# Altium project Bio-Tracking-Device.PrjPcb (part 3 of 4)

## Sheet Controller-Sheet.SchDoc
size 420 x 297 mm; SheetNumber: 4; SheetTotal: 6
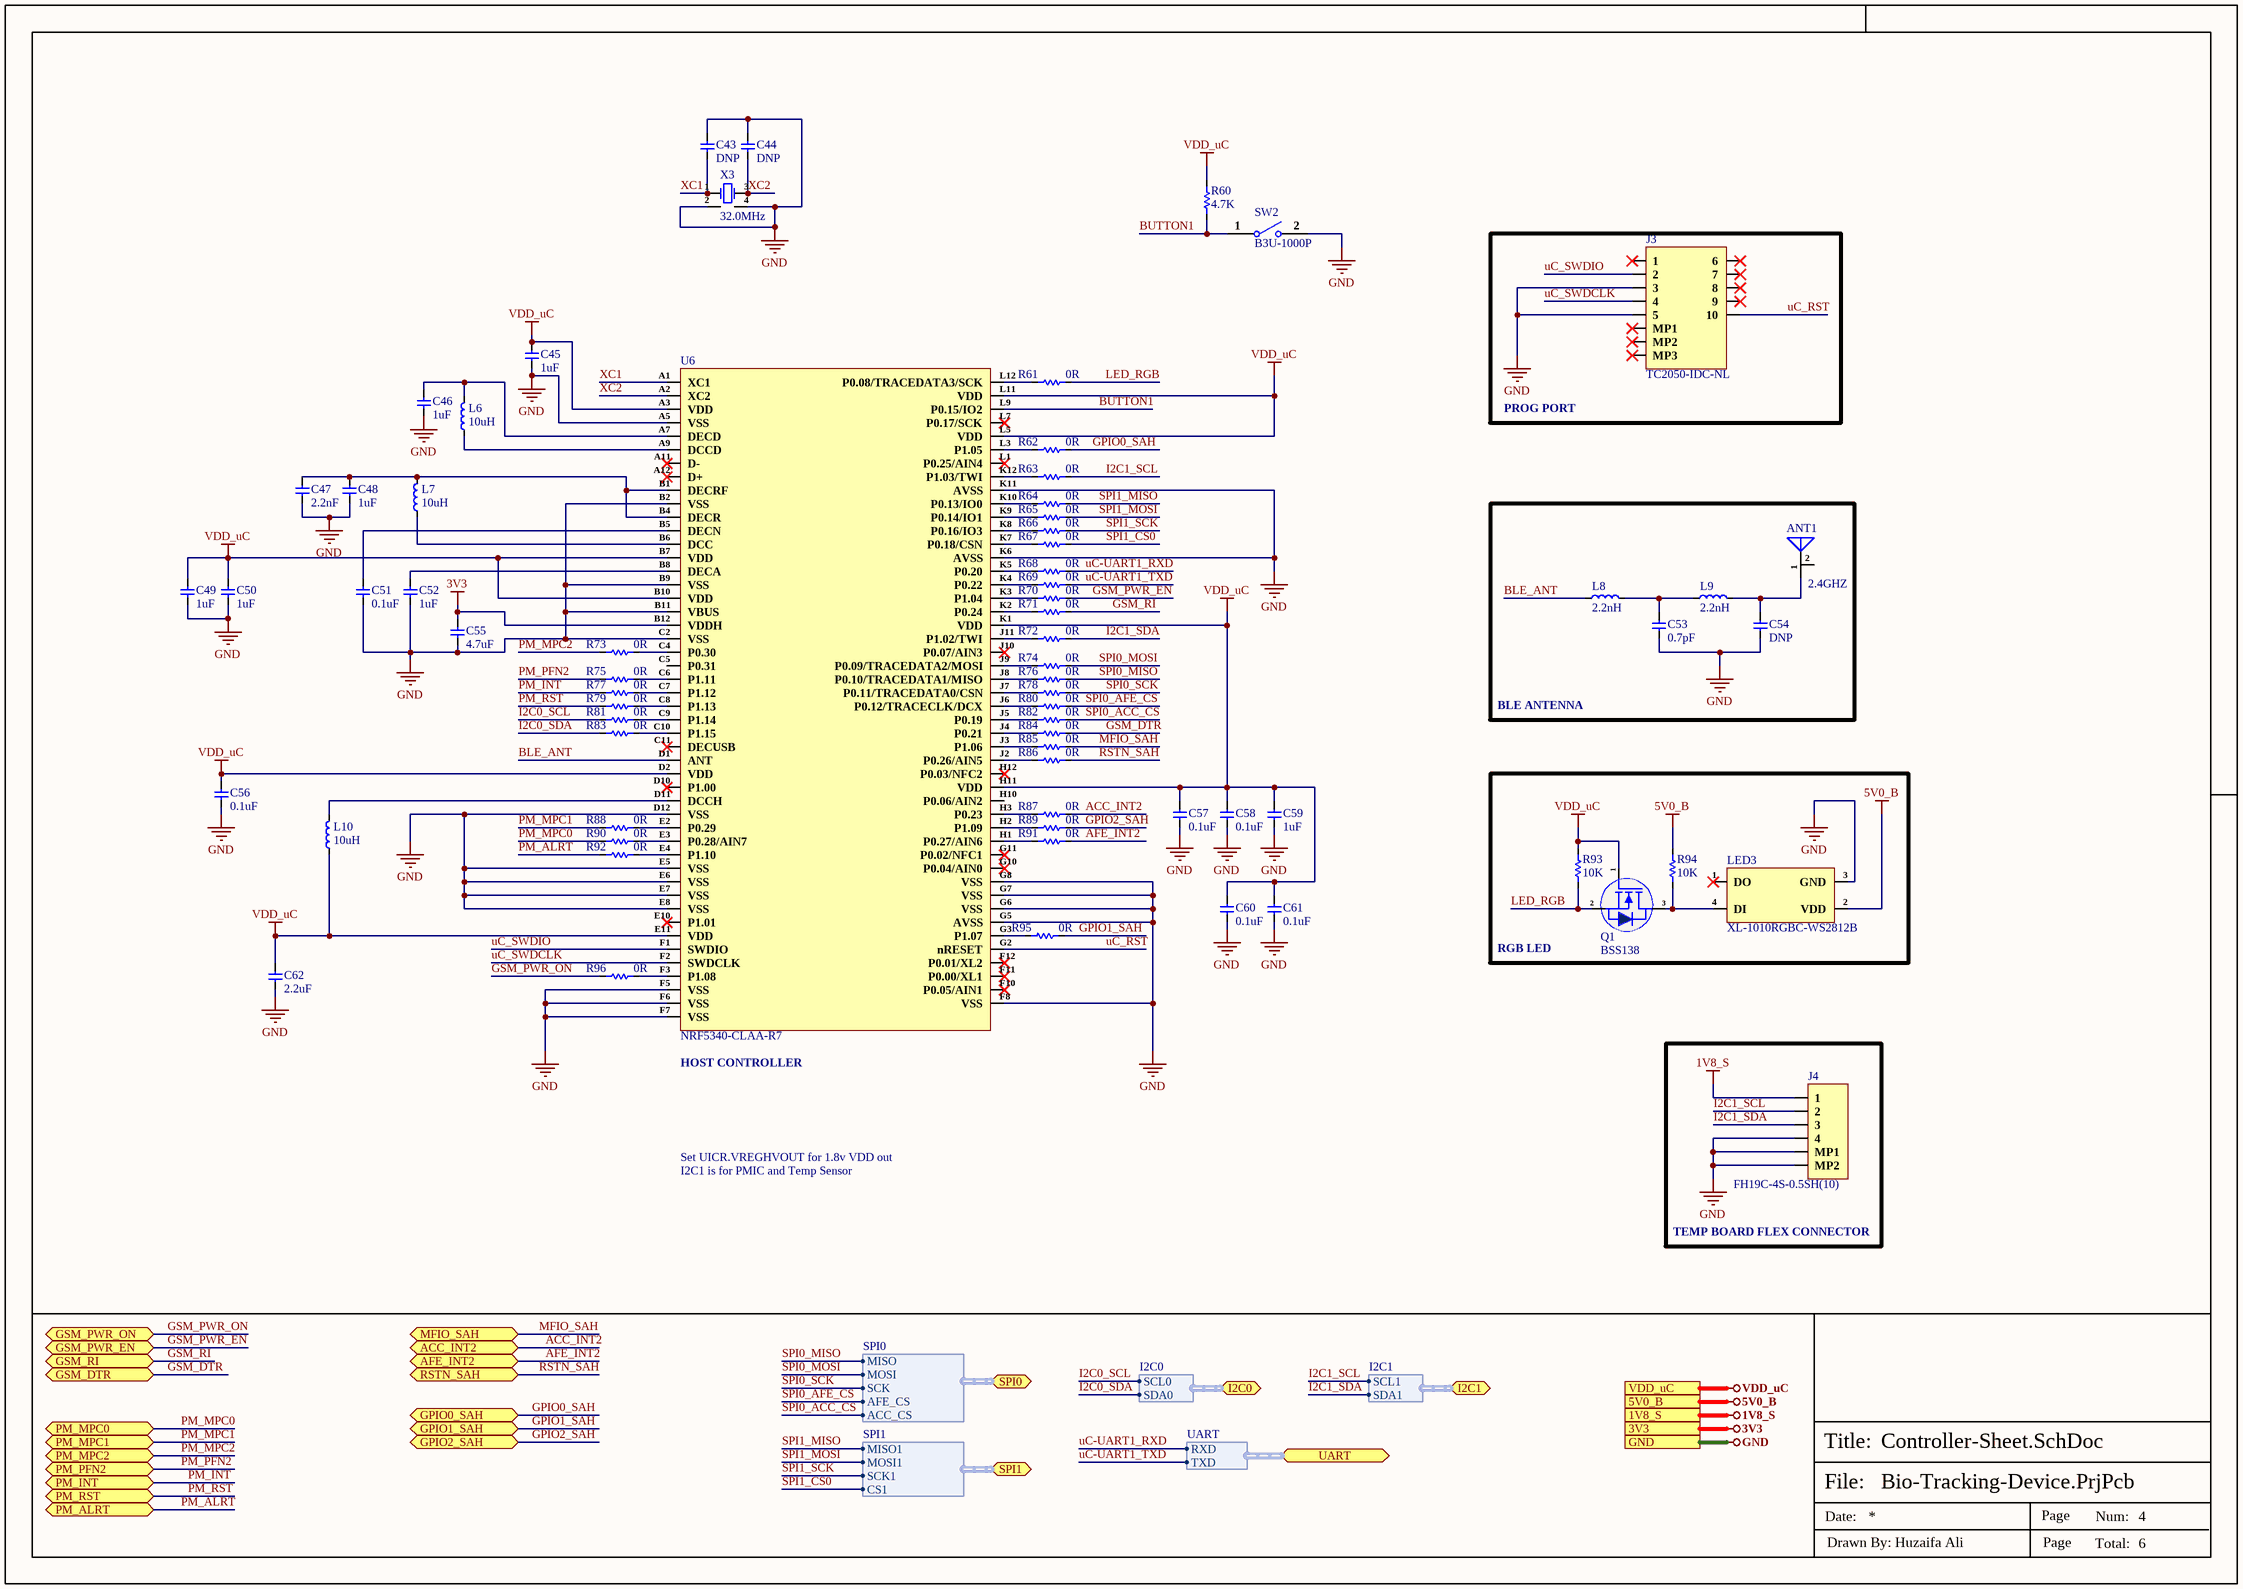
[diagram p3: Controller-Sheet.SchDoc]

### Parts
ANT1  2.4GHZ  [RFANT3216120A5T]
C43  DNP  [CAP-0201]
C44  DNP  [CAP-0201]
C45  1uF  [Cap-0402]
C46  1uF  [Cap-0402]
C47  2.2nF  [CAP-0201]
C48  1uF  [Cap-0402]
C49  1uF  [Cap-0402]
C50  1uF  [Cap-0402]
C51  0.1uF  [CAP-0201]
C52  1uF  [Cap-0402]
C53  0.7pF  [CAP-0201]
C54  DNP  [CAP-0201]
C55  4.7uF  [Cap-0603]
C56  0.1uF  [CAP-0201]
C57  0.1uF  [CAP-0201]
C58  0.1uF  [CAP-0201]
C59  1uF  [Cap-0402]
C60  0.1uF  [CAP-0201]
C61  0.1uF  [CAP-0201]
C62  2.2uF  [Cap-0603]
J3  TC2050-IDC-NL  [TC2050-IDC-NL_]
J4  FH19C-4S-0.5SH(10)  [FH19C-4S-0.5SH(10)]
L6  10uH  [IND-0603 (1608 Metric)]
L7  10uH  [IND-0603 (1608 Metric)]
L8  2.2nH  [IND-0201]
L9  2.2nH  [IND-0201]
L10  10uH  [IND-0603 (1608 Metric)]
LED3  XL-1010RGBC-WS2812B  [XL-1010RGBC-WS2812B]
Q1  BSS138  [Sot-23]
R60  4.7K  [Res-0201]
R61  0R  [Res-0201]
R62  0R  [Res-0201]
R63  0R  [Res-0201]
R64  0R  [Res-0201]
R65  0R  [Res-0201]
R66  0R  [Res-0201]
R67  0R  [Res-0201]
R68  0R  [Res-0201]
R69  0R  [Res-0201]
R70  0R  [Res-0201]
R71  0R  [Res-0201]
R72  0R  [Res-0201]
R73  0R  [Res-0201]
R74  0R  [Res-0201]
R75  0R  [Res-0201]
R76  0R  [Res-0201]
R77  0R  [Res-0201]
R78  0R  [Res-0201]
R79  0R  [Res-0201]
R80  0R  [Res-0201]
R81  0R  [Res-0201]
R82  0R  [Res-0201]
R83  0R  [Res-0201]
R84  0R  [Res-0201]
R85  0R  [Res-0201]
R86  0R  [Res-0201]
R87  0R  [Res-0201]
R88  0R  [Res-0201]
R89  0R  [Res-0201]
R90  0R  [Res-0201]
R91  0R  [Res-0201]
R92  0R  [Res-0201]
R93  10K  [Res-0402]
R94  10K  [Res-0402]
R95  0R  [Res-0201]
R96  0R  [Res-0201]
SW2  B3U-1000P  [B3U-1000P]
U6  NRF5340-CLAA-R7  [95-WLCSP (4.39x3.85)]
X3  32.0MHz  [SMD2016-4P]

### Blocks framed on the sheet
PROG PORT: J3
BLE ANTENNA: ANT1 C53 C54 L8 L9
RGB LED: LED3 Q1 R93 R94
TEMP BOARD FLEX CONNECTOR: J4

### Ports
1V8_S (see Top-Sheet[3B], Power-Sheet[5D], Sensor-Sheet[5D], Temp-Sensor-Sheet[3D]), 3V3 (see Top-Sheet[3A], Power-Sheet[5D], Sensor-Sheet[5D]), 5V0_B (see Top-Sheet[3B], Power-Sheet[5D], Sensor-Sheet[5D]), ACC_INT2 (bidir, see Top-Sheet[4B], Sensor-Sheet[1D]), AFE_INT2 (bidir, see Top-Sheet[4B], Sensor-Sheet[1D]), GND (see Top-Sheet[3A], GSM-Sheet[5D], Power-Sheet[5D], Sensor-Sheet[5D], Temp-Sensor-Sheet[3D]), GPIO0_SAH (bidir, see Top-Sheet[4B], Sensor-Sheet[1D]), GPIO1_SAH (bidir, see Top-Sheet[4B], Sensor-Sheet[1D]), GPIO2_SAH (bidir, see Top-Sheet[4B], Sensor-Sheet[1D]), GSM_DTR (bidir, see Top-Sheet[3B], GSM-Sheet[1D]), GSM_PWR_EN (bidir, see Top-Sheet[3B], Power-Sheet[1D]), GSM_PWR_ON (bidir, see Top-Sheet[3B], GSM-Sheet[1D]), GSM_RI (bidir, see Top-Sheet[3B], GSM-Sheet[1D]), I2C0 (bidir, harness I2C0, see Top-Sheet[4B], Sensor-Sheet[3D]), I2C1 (bidir, harness I2C1, see Top-Sheet[4C], Power-Sheet[3D], Temp-Sensor-Sheet[2D]), MFIO_SAH (bidir, see Top-Sheet[4B], Sensor-Sheet[1D]), PM_ALRT (bidir, see Top-Sheet[3B], Power-Sheet[1D]), PM_INT (bidir, see Top-Sheet[3B], Power-Sheet[1D]), PM_MPC0 (bidir, see Top-Sheet[3B], Power-Sheet[1D]), PM_MPC1 (bidir, see Top-Sheet[3B], Power-Sheet[1D]), PM_MPC2 (bidir, see Top-Sheet[3B], Power-Sheet[1D]), PM_PFN2 (bidir, see Top-Sheet[3B], Power-Sheet[1D]), PM_RST (bidir, see Top-Sheet[3B], Power-Sheet[1D]), RSTN_SAH (bidir, see Top-Sheet[4B], Sensor-Sheet[1D]), SPI0 (bidir, harness SPI0, see Top-Sheet[4B], Sensor-Sheet[4D]), SPI1 (bidir, harness SPI1, see Top-Sheet[4B], Sensor-Sheet[4D]), UART (bidir, harness UART, see Top-Sheet[3B], GSM-Sheet[3D]), VDD_uC (see Top-Sheet[3B], GSM-Sheet[5D], Power-Sheet[5D])

### Harnesses
I2C0: SCL0, SDA0
I2C1: SCL1, SDA1
UART: RXD, TXD
SPI1: MISO1, MOSI1, SCK1, CS1
SPI0: MISO, MOSI, SCK, AFE_CS, ACC_CS

### Nets
1V8_S: J4.1 ; port 1V8_S
3V3: C55.2 U6.B12(VDDH) ; port 3V3
5V0_B: LED3.2(VDD) R94.2 ; port 5V0_B
GND: C43.2 C44.2 C45.1 C46.1 C47.1 C48.1 C49.1 C50.1 C51.1 C52.1 C53.1 C54.1 C55.1 C56.1 C57.1 C58.1 C59.1 C60.1 C61.1 C62.1 J3.3 J3.5 J4.4 J4.MP1 J4.MP2 LED3.3(GND) SW2.2 U6.A5(VSS) U6.B2(VSS) U6.B9(VSS) U6.B11(VBUS) U6.C2(VSS) U6.D12(VSS) U6.E5(VSS) U6.E6(VSS) U6.E7(VSS) U6.E8(VSS) U6.F5(VSS) U6.F6(VSS) U6.F7(VSS) U6.F8(VSS) U6.G5(AVSS) U6.G6(VSS) U6.G7(VSS) U6.G8(VSS) U6.K6(AVSS) U6.K11(AVSS) X3.2(GND) X3.4(GND) ; port GND
VDD_uC: C45.2 C49.2 C50.2 C56.2 C57.2 C58.2 C59.2 C60.2 C61.2 C62.2 L10.1 Q1.1(G) R60.2 R93.2 U6.A3(VDD) U6.B7(VDD) U6.B10(VDD) U6.D2(VDD) U6.E11(VDD) U6.H11(VDD) U6.K1(VDD) U6.L5(VDD) U6.L11(VDD) ; port VDD_uC
ACC_INT2: R87.2 ; port ACC_INT2
AFE_INT2: R91.2 ; port AFE_INT2
BLE_ANT: L8.1 U6.D1(ANT)
BUTTON1: R60.1 SW2.1 U6.L9(P0.15/IO2)
GPIO0_SAH: R62.2 ; port GPIO0_SAH
GPIO1_SAH: R95.2 ; port GPIO1_SAH
GPIO2_SAH: R89.2 ; port GPIO2_SAH
GSM_DTR: R84.2 ; port GSM_DTR
GSM_PWR_EN: R70.2 ; port GSM_PWR_EN
GSM_PWR_ON: R96.1 ; port GSM_PWR_ON
GSM_RI: R71.2 ; port GSM_RI
I2C0_SCL: R81.1 ; port I2C0.SCL0
I2C0_SDA: R83.1 ; port I2C0.SDA0
I2C1_SCL: J4.2 R63.2 ; port I2C1.SCL1
I2C1_SDA: J4.3 R72.2 ; port I2C1.SDA1
LED_RGB: Q1.2(S) R61.2 R93.1
MFIO_SAH: R85.2 ; port MFIO_SAH
PM_ALRT: R92.1 ; port PM_ALRT
PM_INT: R77.1 ; port PM_INT
PM_MPC0: R90.1 ; port PM_MPC0
PM_MPC1: R88.1 ; port PM_MPC1
PM_MPC2: R73.1 ; port PM_MPC2
PM_PFN2: R75.1 ; port PM_PFN2
PM_RST: R79.1 ; port PM_RST
RSTN_SAH: R86.2 ; port RSTN_SAH
SPI0_ACC_CS: R82.2 ; port SPI0.ACC_CS
SPI0_AFE_CS: R80.2 ; port SPI0.AFE_CS
SPI0_MISO: R76.2 ; port SPI0.MISO
SPI0_MOSI: R74.2 ; port SPI0.MOSI
SPI0_SCK: R78.2 ; port SPI0.SCK
SPI1_CS0: R67.2 ; port SPI1.CS1
SPI1_MISO: R64.2 ; port SPI1.MISO1
SPI1_MOSI: R65.2 ; port SPI1.MOSI1
SPI1_SCK: R66.2 ; port SPI1.SCK1
uC-UART1_RXD: R68.2 ; port UART.RXD
uC-UART1_TXD: R69.2 ; port UART.TXD
uC_RST: J3.10 U6.G2(nRESET)
uC_SWDCLK: J3.4 U6.F2(SWDCLK)
uC_SWDIO: J3.2 U6.F1(SWDIO)
XC1: C43.1 U6.A1(XC1) X3.1(IN/OUT)
XC2: C44.1 U6.A2(XC2) X3.3(Out/In)
NetANT1_1: ANT1.1(A) C54.2 L9.2
NetC46_2: C46.2 L6.2 U6.A7(DECD)
NetC47_2: C47.2 C48.2 L7.2 U6.B1(DECRF) U6.B4(DECR)
NetC51_2: C51.2 U6.B5(DECN)
NetC52_2: C52.2 U6.B8(DECA)
NetC53_2: C53.2 L8.2 L9.1
NetL6_1: L6.1 U6.A9(DCCD)
NetL7_1: L7.1 U6.B6(DCC)
NetL10_2: L10.2 U6.D11(DCCH)
NetLED3_4: LED3.4(DI) Q1.3(D) R94.1
NetR61_1: R61.1 U6.L12(P0.08/TRACEDATA3/SCK)
NetR62_1: R62.1 U6.L3(P1.05)
NetR63_1: R63.1 U6.K12(P1.03/TWI)
NetR64_1: R64.1 U6.K10(P0.13/IO0)
NetR65_1: R65.1 U6.K9(P0.14/IO1)
NetR66_1: R66.1 U6.K8(P0.16/IO3)
NetR67_1: R67.1 U6.K7(P0.18/CSN)
NetR68_1: R68.1 U6.K5(P0.20)
NetR69_1: R69.1 U6.K4(P0.22)
NetR70_1: R70.1 U6.K3(P1.04)
NetR71_1: R71.1 U6.K2(P0.24)
NetR72_1: R72.1 U6.J11(P1.02/TWI)
NetR73_2: R73.2 U6.C4(P0.30)
NetR74_1: R74.1 U6.J9(P0.09/TRACEDATA2/MOSI)
NetR75_2: R75.2 U6.C6(P1.11)
NetR76_1: R76.1 U6.J8(P0.10/TRACEDATA1/MISO)
NetR77_2: R77.2 U6.C7(P1.12)
NetR78_1: R78.1 U6.J7(P0.11/TRACEDATA0/CSN)
NetR79_2: R79.2 U6.C8(P1.13)
NetR80_1: R80.1 U6.J6(P0.12/TRACECLK/DCX)
NetR81_2: R81.2 U6.C9(P1.14)
NetR82_1: R82.1 U6.J5(P0.19)
NetR83_2: R83.2 U6.C10(P1.15)
NetR84_1: R84.1 U6.J4(P0.21)
NetR85_1: R85.1 U6.J3(P1.06)
NetR86_1: R86.1 U6.J2(P0.26/AIN5)
NetR87_1: R87.1 U6.H3(P0.23)
NetR88_2: R88.2 U6.E2(P0.29)
NetR89_1: R89.1 U6.H2(P1.09)
NetR90_2: R90.2 U6.E3(P0.28/AIN7)
NetR91_1: R91.1 U6.H1(P0.27/AIN6)
NetR92_2: R92.2 U6.E4(P1.10)
NetR95_1: R95.1 U6.G3(P1.07)
NetR96_2: R96.2 U6.F3(P1.08)

Not connected (* = marked no-connect by the designer): ANT1 2(NC); J3 1* 6* 7* 8* 9* MP1* MP2* MP3*; LED3 1(DO)*; U6 A11(D-)* A12(D+)* C5(P0.31) C11(DECUSB)* D10(P1.00)* E10(P1.01)* F10(P0.05/AIN1)* F11(P0.00/XL1)* F12(P0.01/XL2)* G10(P0.04/AIN0)* G11(P0.02/NFC1)* H10(P0.06/AIN2) H12(P0.03/NFC2)* J10(P0.07/AIN3)* L1(P0.25/AIN4)* L7(P0.17/SCK)*

### Notes on the sheet
- (near U6) HOST CONTROLLER
- Set UICR.VREGHVOUT for 1.8v VDD out
- I2C1 is for PMIC and Temp Sensor
- File:
- Title:
- Date:
- Page
- Num:
- Total:
- Drawn By: Huzaifa Ali

### Library data of the parts
ANT1 = RFANT3216120A5T: 2.4GHZ CERAMIC CHIP ANTENNA; Manufacturer: Walsin Technologies; Bandwidth: 150MHz; Impedance: 50R; Number of Bands: 1; VSWR: 2; Supplier: Digikey; Supplier Part Number: 1292-1000-1-ND; Manufacturer Part Number: RFANT3216120A5T; RoHS: Yes; Category: RF Antennas; Stock: 28669; Pricing: 1=0.5, 10=0.403, 25=0.3692, 100=0.2747, 250=0.24896, 500=0.20604, 1000=0.15453 (USD); Mounting Technology: Surface Mount; Case/Package: CSMD; Pins: 2; Package Quantity: 2000; Packaging: Tape and Reel; Frequency: 2.4GHz; Termination: Solder; Series: -; Radiation Hardening: No; ComponentLink1URL: https://datasheet.ciiva.com/26865/getdatasheetpartid-490374-26865067.pdf?src-supplier=Verical; ComponentLink1Description: https://datasheet.ciiva.com/26865/getdatasheetpartid-490374-26865067.pdf?src-supplier=Verical; ComponentLink2URL: https://datasheet.ciiva.com/26233/1-2rfant3216120a5t-26233244.pdf?src-supplier=Digikey; ComponentLink2Description: https://datasheet.ciiva.com/26233/1-2rfant3216120a5t-26233244.pdf?src-supplier=Digikey; ComponentLink3URL: https://datasheet.ciiva.com/26233/1-2rfant3216120a5t-26233238.pdf?src-supplier=Digikey; ComponentLink3Description: https://datasheet.ciiva.com/26233/1-2rfant3216120a5t-26233238.pdf?src-supplier=Digikey; LCSC Part Number: C127629; Item Type: Antenna
C43 C44 = GRM0335C1E2R0BA01D: CAP CER 2PF 25V C0G/NP0 0201; Manufacturer: Murata; Item Type: Capacitor; Supplier 1: Arrow Electronics; Manufacturer Part Number: GRM0335C1E2R0BA01D; RoHS: Yes; Category: Ceramic Capacitors; Stock 1: 65754; Pricing 1: 1=0.053, 10=0.0058, 25=0.004, 100=0.0026, 500=0.0024, 1000=0.0023, 3000=0.0022, 6000=0.0021, 15000=0.002, 30000=0.0019 (USD); ComponentLink1URL: https://datasheet.ciiva.com/29535/grm0335c1e2r0ba01-01-29535294.pdf?src-supplier=Digi-Key; ComponentLink1Description: https://datasheet.ciiva.com/29535/grm0335c1e2r0ba01-01-29535294.pdf?src-supplier=Digi-Key; Supplier Part Number 1: GRM0335C1E2R0BA01D; LCSC Part Number: C161383
C45 C46 C48-C50 C52 C59 = GRM155C71C105KE11D: CAP CER 1UF 16V X7S 0402; Manufacturer: Murata; Item Type: Capacitors; Material: 4241ConductorMaterial; Tolerance: 10%; Dielectric: 1542DielectricType; Supplier: Mouser; LCSC Part Number: C576449; Manufacturer Part Number: GRM155C71C105KE11D; RoHS: No; Stock: 16102; Pricing: 1=0.11, 10=0.041, 50=0.041, 100=0.026, 1000=0.023, 10000=0.016 (USD); Case/Package: 343Case; Min Operating Temperature: -55°C; Max Operating Temperature: 125°C; Value: 1uF; Voltage Rating: 16V; Voltage Rating (DC): 16V; Length: 1mm; Width: 500um; Height: 600um; Thickness: 500um
C47 = CC0201JRX7R7BB222: CAP CER 2200PF 16V X7R 0201; Manufacturer: Yageo; Item Type: Capacitors; Tolerance: 5%; Supplier: Digikey; LCSC Part Number: C526940; Manufacturer Part Number: CC0201JRX7R7BB222; RoHS: Yes; Stock: 18403; Pricing: 1=0.1, 10=0.035, 50=0.02, 100=0.0155, 500=0.0117, 1000=0.00919, 2500=0.00836, 5000=0.00769 (USD); Mounting Technology: Surface Mount; Case/Package: 0201; Min Operating Temperature: -55°C; Max Operating Temperature: 125°C; Packaging: Tape and Reel; Value: 2.2nF; Voltage Rating: 16V; Voltage Rating (DC): 16V; Dielectric: X7R; Series: CC; Lead Free: Lead Free; Halogen Free: Halogen Free; ComponentLink1URL: http://www.yageo.com/documents/recent/UPY-GPHC_X7R_6.3V-to-50V_18.pdf?src-supplier=Digikey; ComponentLink1Description: http://www.yageo.com/documents/recent/UPY-GPHC_X7R_6.3V-to-50V_18.pdf?src-supplier=Digikey
C51 C56-C58 C60 C61 = GRM033C71C104KE14D: CAP CER 0.1UF 16V X7S 0201; Manufacturer: Murata; Item Type: Capacitors; Material: 4241ConductorMaterial; Supplier: Future Electronics; LCSC Part Number: C85923; Manufacturer Part Number: GRM033C71C104KE14D; RoHS: Yes; Stock: 15000; Pricing: 15000=0.0042, 45000=0.0041, 75000=0.004, 300000=0.0038, 450000=0.0037 (USD); ComponentLink1URL: http://www.mouser.com/ds/2/281/c02e-2905.pdf?src-supplier=Mouser; ComponentLink1Description: http://www.mouser.com/ds/2/281/c02e-2905.pdf?src-supplier=Mouser; ComponentLink2URL: http://www.farnell.com/datasheets/2867828.pdf?src-supplier=Farnell; ComponentLink2Description: http://www.farnell.com/datasheets/2867828.pdf?src-supplier=Farnell; ComponentLink3URL: http://www.farnell.com/datasheets/2867828.pdf?src-supplier=Newark; ComponentLink3Description: http://www.farnell.com/datasheets/2867828.pdf?src-supplier=Newark; ComponentLink4URL: http://www.farnell.com/datasheets/2867828.pdf?src-supplier=Element14; ComponentLink4Description: http://www.farnell.com/datasheets/2867828.pdf?src-supplier=Element14; ComponentLink5URL: https://search.murata.co.jp/Ceramy/image/img/A01X/G101/ENG/GRM033C71C104KE14-01.pdf?src-supplier=Digikey; ComponentLink5Description: https://search.murata.co.jp/Ceramy/image/img/A01X/G101/ENG/GRM033C71C104KE14-01.pdf?src-supplier=Digikey; ComponentLink6URL: https://datasheet.octopart.com/GRM033C71C104KE14D-Murata-datasheet-22122223.pdf?src-supplier=Future+Electronics; ComponentLink6Description: https://datasheet.octopart.com/GRM033C71C104KE14D-Murata-datasheet-22122223.pdf?src-supplier=Future+Electronics; ComponentLink7URL: https://datasheet.octopart.com/GRM033C71C104KE14D-Murata-datasheet-165579666.pdf?src-supplier=TME; ComponentLink7Description: https://datasheet.octopart.com/GRM033C71C104KE14D-Murata-datasheet-165579666.pdf?src-supplier=TME
C53 C54 = GJM0335C1ER70WB01D: CAP CER 0.70PF 25V NP0 0201; Manufacturer: Murata; Item Type: Capacitors; Supplier: Mouser; LCSC Part Number: C907945; Manufacturer Part Number: GJM0335C1ER70WB01D; RoHS: Yes; Stock: 12907; Pricing: 1=0.13, 10=0.051, 50=0.051, 100=0.031, 1000=0.025, 10000=0.02 (USD); ComponentLink1URL: https://datasheet.ciiva.com/170/product-170844.pdf?src-supplier=Digikey; ComponentLink1Description: https://datasheet.ciiva.com/170/product-170844.pdf?src-supplier=Digikey; ComponentLink2URL: https://datasheet.ciiva.com/11616/product-11616940.pdf?src-supplier=Avnet; ComponentLink2Description: https://datasheet.ciiva.com/11616/product-11616940.pdf?src-supplier=Avnet
C55 = GRM188C71C475KE21D: CAP CER 4.7UF 16V X7S 0603; Manufacturer: Murata; Item Type: Capacitors; Material: 4241ConductorMaterial; Tolerance: 10%; Dielectric: 1542DielectricType; Supplier: Mouser; LCSC Part Number: C237615; Manufacturer Part Number: GRM188C71C475KE21D; RoHS: Yes; Stock: 23513; Pricing: 1=0.27, 10=0.113, 50=0.113, 100=0.075, 1000=0.067, 10000=0.046 (USD); Mounting Technology: Surface Mount; Case/Package: 0603; Min Operating Temperature: -55°C; Max Operating Temperature: 125°C; Series: GRM; Voltage Rating: 16V; Voltage Rating (DC): 16V; Value: 4.7uF; Length: 1.6mm; Width: 800um; Height: 950um; Thickness: 800um; RoHS Compliant: Yes; ComponentLink1URL: http://search.murata.co.jp/Ceramy/image/img/A01X/G101/ENG/GRM188C71C475KE21-01.pdf?src-supplier=Digikey; ComponentLink1Description: http://search.murata.co.jp/Ceramy/image/img/A01X/G101/ENG/GRM188C71C475KE21-01.pdf?src-supplier=Digikey
C62 = CL10Y225KO96PNC: 16V 2.2uF X7S ±10% 0603 Multilayer Ceramic Capacitors MLCC - SMD/SMT ROHS; Manufacturer: Samsung; Supplier: Mouser; LCSC Part Number: C22371069; Manufacturer Part Number: CL10Y225KO96PNC; RoHS: No; Item Type: Capacitor; Stock: 20471; Pricing: 1=0.24, 10=0.155, 50=0.155, 100=0.088, 1000=0.058, 10000=0.045 (USD)
J3 = TC2050-IDC-NL: CBL PLUG-OF-NAILS 10-PIN; Manufacturer: Tag-Connect; Supplier 1: Digi-Key; Manufacturer Part Number: TC2050-IDC-NL; Stock 1: 544; Pricing 1: 1=40.17 (USD); Package Quantity: 1; ComponentLink1URL: http://www.tag-connect.com/Materials/TC2050-IDC-NL%20Datasheet.pdf?src-supplier=Digi-Key; ComponentLink1Description: http://www.tag-connect.com/Materials/TC2050-IDC-NL%20Datasheet.pdf?src-supplier=Digi-Key; Supplier Part Number 1: TC2050-IDC-NL-ND
J4 = FH19C-4S-0.5SH(10): CONN FFC BOTTOM 4POS 0.5MM R/A; Manufacturer: Hirose; Actuator Material: Polymer,Polyphenylene,Liquid Crystal Polymer; Voltage Rating: 50V; Current Rating: 500mA; Number of Positions: 4; Insulation Resistance: 500MR; Wire/Cable Type: Flat Flex; Pitch: 0.02inch; Item Type: FPC Connector; Supplier 1: Digi-Key; Manufacturer Part Number: FH19C-4S-0.5SH(10); RoHS: Yes; Category: FFC / FPC; Stock 1: 7956; Pricing 1: 1=1.08, 10=0.916, 25=0.878, 50=0.8596, 100=0.8221, 250=0.7474, 500=0.67266, 1000=0.59792, 2500=0.54186 (USD); Mounting Technology: Surface Mount; Contact Material: Bronze; Contact Plating: Gold; Housing Material: Polymer; Min Operating Temperature: -55°C; Max Operating Temperature: 85°C; Packaging: Tape and Reel; Package Quantity: 5000; Termination: Solder; Series: FH19C; Flammability Rating: UL94 V-0; RoHS Compliant: Yes; ComponentLink1URL: https://datasheet.ciiva.com/18563/ed-fh19cfh19sc-20140305-18563548.pdf?src-supplier=Digi-Key; ComponentLink1Description: https://datasheet.ciiva.com/18563/ed-fh19cfh19sc-20140305-18563548.pdf?src-supplier=Digi-Key; Supplier Part Number 1: H125822CT-ND; LCSC Part Number: C424650
L6 L7 L10 = MLZ1608M100WT000: FIXED IND 10UH 250MA 1.05OHM SMD; Manufacturer: TDK; Item Type: Inductors; Core Material: Ferrite; Tolerance: 20%; Saturation Current: 90mA; Shielding: Shielded; Value: 1.05R; DC Resistance (DCR): 1.365R; Self Resonant Frequency: 50MHz; Test Frequency: 2MHz; Supplier: Digikey; LCSC Part Number: C76798; Manufacturer Part Number: MLZ1608M100WT000; RoHS: Yes; Stock: 146199; Pricing: 1=0.14, 10=0.09, 25=0.0804, 50=0.0706, 100=0.0617, 250=0.05292 (USD); Mounting Technology: Surface Mount; Case/Package: 0603; Case Code (Metric): 1608; Case Code (Imperial): 0603; Min Operating Temperature: -55°C; Max Operating Temperature: 125°C; Package Quantity: 4000; Packaging: Cut Tape; Current Rating: 250mA; Series: MLZ; RMS Current (Irms): 250mA; ESR: 1.05R; Length: 0.063inch; Width: 0.031inch; Height: 950um; Height - Seated (Max): 0.037inch; RoHS Compliant: Yes; ComponentLink1URL: https://product.tdk.com/info/en/catalog/datasheets/inductor_commercial_decoupling_mlz1608_en.pdf?src-supplier=Digikey; ComponentLink1Description: https://product.tdk.com/info/en/catalog/datasheets/inductor_commercial_decoupling_mlz1608_en.pdf?src-supplier=Digikey; ComponentLink2URL: https://datasheet.octopart.com/MLZ1608M100WT000-TDK-datasheet-12356712.pdf?src-supplier=Newark; ComponentLink2Description: https://datasheet.octopart.com/MLZ1608M100WT000-TDK-datasheet-12356712.pdf?src-supplier=Newark; ComponentLink3URL: https://datasheet.octopart.com/MLZ1608M100WT000-TDK-datasheet-38159369.pdf?src-supplier=Future+Electronics; ComponentLink3Description: https://datasheet.octopart.com/MLZ1608M100WT000-TDK-datasheet-38159369.pdf?src-supplier=Future+Electronics
L8 L9 = LQP03HQ2N2B02D: FIXED IND 2.2NH 600MA 120MOHM SM; Manufacturer: Murata; Item Type: Inductors; Q Factor: 20NUMBER; Value: 120mR; Supplier: Mouser; LCSC Part Number: C1329438; Manufacturer Part Number: LQP03HQ2N2B02D; RoHS: Yes; Stock: 22323; Pricing: 1=0.15, 10=0.096, 50=0.096, 100=0.075, 1000=0.061, 10000=0.056 (USD); RMS Current (Irms): 600mA; ESR: 120mR; Height: 420um; ComponentLink1URL: https://datasheet.octopart.com/LQP03HQ2N2B02D-Murata-datasheet-68295820.pdf?src-supplier=Future+Electronics; ComponentLink1Description: https://datasheet.octopart.com/LQP03HQ2N2B02D-Murata-datasheet-68295820.pdf?src-supplier=Future+Electronics; ComponentLink2URL: http://search.murata.co.jp/Ceramy/image/img/P02/JELF243C-0021.pdf?src-supplier=Digikey; ComponentLink2Description: http://search.murata.co.jp/Ceramy/image/img/P02/JELF243C-0021.pdf?src-supplier=Digikey; ComponentLink3URL: https://search.murata.co.jp/Ceramy/image/img/P02/JELF243C-0021.pdf?src-supplier=Digikey; ComponentLink3Description: https://search.murata.co.jp/Ceramy/image/img/P02/JELF243C-0021.pdf?src-supplier=Digikey; ComponentLink4URL: https://datasheet.octopart.com/LQP03HQ2N2B02D-Murata-datasheet-112158819.pdf?src-supplier=Newark; ComponentLink4Description: https://datasheet.octopart.com/LQP03HQ2N2B02D-Murata-datasheet-112158819.pdf?src-supplier=Newark; ComponentLink5URL: https://datasheet.octopart.com/LQP03HQ2N2B02D-Murata-datasheet-150539062.pdf?src-supplier=Arrow.cn; ComponentLink5Description: https://datasheet.octopart.com/LQP03HQ2N2B02D-Murata-datasheet-150539062.pdf?src-supplier=Arrow.cn
LED3 = XL-1010RGBC-WS2812B: Colorless transparence -40℃~+150℃ 正贴 RGB 120° 1010 Light Emitting Diodes (LED) ROHS; Manufacturer: XINGLIGHT; Item Type: RGB LED; Manufacturer Part Number: XL-1010RGBC-WS2812B; Package: 1010; LCSC Part Number: C5349953; ComponentLink1Description: LCSC; ComponentLink1URL: https://www.lcsc.com/product-detail/Light-Emitting-Diodes-LED_XINGLIGHT-XL-1010RGBC-WS2812B_C5349953.html
Q1 = BSS138: 50V 220mA 3.5Ω@10V,220mA 225mW 1.6V@1mA N Channel SOT-23 MOSFETs ROHS; Manufacturer: Slkor(SLKORMICRO Elec.); Item Type: Mosfet; Manufacturer Part Number: BSS138; Package: SOT-23; LCSC Part Number: C426569; ComponentLink1Description: LCSC; ComponentLink1URL: https://www.lcsc.com/product-detail/MOSFETs_Slkor-SLKORMICRO-Elec-BSS138_C426569.html
R60 = RC0201FR-074K7L: RES 4.7K OHM 1% 1/20W 0201; Manufacturer: Yageo; Item Type: Resistor; Supplier: Future Electronics; Supplier Part Number: 7537285; Manufacturer Part Number: RC0201FR-074K7L; RoHS: Yes; Category: Chip SMD Resistors; Stock: 1610000; Pricing: 10000=0.0014, 50000=0.0013, 250000=0.0013, 750000=0.0012, 2000000=0.0011 (USD); ComponentLink1URL: https://datasheet.ciiva.com/2493/pyu-r-int-thick-7-2493811.pdf?src-supplier=Digi-Key; ComponentLink1Description: https://datasheet.ciiva.com/2493/pyu-r-int-thick-7-2493811.pdf?src-supplier=Digi-Key; ComponentLink2URL: https://datasheet.ciiva.com/2493/pyu-r-int-thick-7-2493812.pdf?src-supplier=Digi-Key; ComponentLink2Description: https://datasheet.ciiva.com/2493/pyu-r-int-thick-7-2493812.pdf?src-supplier=Digi-Key; ComponentLink3URL: https://datasheet.ciiva.com/2493/pyu-r-int-thick-7-2493813.pdf?src-supplier=Digi-Key; ComponentLink3Description: https://datasheet.ciiva.com/2493/pyu-r-int-thick-7-2493813.pdf?src-supplier=Digi-Key; ComponentLink4URL: https://datasheet.ciiva.com/8892/pyu-rc0201-51-rohs-l-8-8892942.pdf?src-supplier=Avnet; ComponentLink4Description: https://datasheet.ciiva.com/8892/pyu-rc0201-51-rohs-l-8-8892942.pdf?src-supplier=Avnet; ComponentLink5URL: https://datasheet.ciiva.com/7672/1563626-7672233.pdf?src-supplier=Element14; ComponentLink5Description: https://datasheet.ciiva.com/7672/1563626-7672233.pdf?src-supplier=Element14; LCSC Part Number: C138135
R61-R92 R95 R96 = 0201WMF0000TEE: 50mW Thick Film Resistors 25V ±1% 0Ω 0201 Chip Resistor - Surface Mount ROHS; Manufacturer: UNI-ROYAL; Manufacturer Part Number: 0201WMF0000TEE; Package: 0201; LCSC Part Number: C473473; Item Type: Resistor; ComponentLink1Description: LCSC; ComponentLink1URL: https://www.lcsc.com/product-detail/Chip-Resistor-Surface-Mount_UNI-ROYAL-Uniroyal-Elec-0201WMF0000TEE_C473473.html
R93 R94 = SR0402FR-7T10KL: RES 10K OHM 1% 1/5W 0402; Manufacturer: Yageo; Supplier 1: Digi-Key; Manufacturer Part Number: SR0402FR-7T10KL; Stock 1: 7859; Pricing 1: 1=0.56, 10=0.398, 100=0.2072, 1000=0.11156, 2500=0.10757, 5000=0.10598 (USD); RoHS Compliant: Yes; ComponentLink1URL: http://www.yageo.com/documents/recent/PYu-SR_D_F%20tol_RoHS_L_3.pdf?src-supplier=Digi-Key; ComponentLink1Description: http://www.yageo.com/documents/recent/PYu-SR_D_F%20tol_RoHS_L_3.pdf?src-supplier=Digi-Key; Supplier Part Number 1: YAG5815CT-ND; LCSC Part Number: C854480
SW2 = B3U-1000P: SWITCH TACTILE SPST-NO 0.05A 12V; Manufacturer: Omron; Mechanical Life: 200000Cycles; Operating Force: 1.5N; Throw Configuration: SPST; Current Rating: 50mA; Contact Resistance: 100mR; Illumination Type: Non-Illuminated,Illuminated; Switch Travel: 0.15mm; Switch Function: Off-Mom; Actuator Type: Standard; Actuator Length: 0.4mm; Ratings: Dust Proof,IP40; ComponentLink1URL: http://www.farnell.com/datasheets/60838.pdf?src-supplier=Farnell; ComponentLink1Description: http://www.farnell.com/datasheets/60838.pdf?src-supplier=Farnell; ComponentLink2URL: http://www.farnell.com/datasheets/60838.pdf?src-supplier=Element14; ComponentLink2Description: http://www.farnell.com/datasheets/60838.pdf?src-supplier=Element14; ComponentLink3URL: https://omronfs.omron.com/en_US/ecb/products/pdf/en-b3u.pdf?src-supplier=Digi-Key; ComponentLink3Description: https://omronfs.omron.com/en_US/ecb/products/pdf/en-b3u.pdf?src-supplier=Digi-Key; ComponentLink4URL: http://www.omron.com/ecb/products/pdf/en-b3u.pdf?src-supplier=Digi-Key; ComponentLink4Description: http://www.omron.com/ecb/products/pdf/en-b3u.pdf?src-supplier=Digi-Key; ComponentLink5URL: https://www.distrelec.biz/Web/Downloads/he/et/B3U_eng_datasheet.pdf?mime=application%2Fpdf&src-supplier=Distrelec; ComponentLink5Description: https://www.distrelec.biz/Web/Downloads/he/et/B3U_eng_datasheet.pdf?mime=application%2Fpdf&src-supplier=Distrelec; ComponentLink6URL: http://www.onlinecomponents.com/productFiles/mf-OM/en-b3u.pdf?src-supplier=Onlinecomponents.com; ComponentLink6Description: http://www.onlinecomponents.com/productFiles/mf-OM/en-b3u.pdf?src-supplier=Onlinecomponents.com; Supplier 1: Digi-Key; Manufacturer Part Number: B3U-1000P; Stock 1: 116454; Pricing 1: 1=1, 10=0.961, 25=0.9064, 50=0.7976, 100=0.7251, 250=0.68888, 500=0.67074, 1000=0.52571 (USD); Mount: Surface Mount; Weight: 0.000776oz; Contact Material: Silver; Min Operating Temperature: -25°C; Max Operating Temperature: 70°C; Packaging: Tape and Reel; Voltage Rating (DC): 12V; Package Quantity: 1; Max Current Rating: 50mA; Termination: SMD/SMT; Orientation: Straight; Max Voltage Rating (DC): 12V; Electrical Life: 200000Cycles; Insulation Resistance: 100MR; Contact Current Rating: 50mA; Length: 4mm; Height: 1.2mm; Depth: 2.5mm; Width: 3mm; REACH SVHC: Unknown; Lead Free: Lead Free; ComponentLink7URL: https://www.verical.com/server-webapp/html/getDatasheet?partID=552554&src-supplier=Verical; ComponentLink7Description: https://www.verical.com/server-webapp/html/getDatasheet?partID=552554&src-supplier=Verical; ComponentLink8URL: http://www.farnell.com/datasheets/1685550.pdf?src-supplier=Element14; ComponentLink8Description: http://www.farnell.com/datasheets/1685550.pdf?src-supplier=Element14; ComponentLink9URL: http://www.farnell.com/datasheets/2610940.pdf?src-supplier=Farnell; ComponentLink9Description: http://www.farnell.com/datasheets/2610940.pdf?src-supplier=Farnell; ComponentLink10URL: https://www.alliedelec.com/m/d/4c8a9ef82804fc3c241a13c1e298fd73.pdf?src-supplier=Allied+Electronics; ComponentLink10Description: https://www.alliedelec.com/m/d/4c8a9ef82804fc3c241a13c1e298fd73.pdf?src-supplier=Allied+Electronics; Supplier Part Number 1: SW1020DKR-ND; LCSC Part Number: C231329; Item Type: Switch
U6 = NRF5340-CLAA-R7: IC RF TXRX+MCU 802.15.4 95WLCSP; Manufacturer: Nordic Semiconductor; Supplier: Digikey; LCSC Part Number: C3606790; Manufacturer Part Number: NRF5340-CLAA-R7; RoHS: No; Item Type: IC; Stock: 2282; Pricing: 1=7.28, 100=6.2, 500=5.39004 (USD)
X3 = MP06003: 32.0MHz GSX-223/1P3MF SM Crystal; Manufacturer: Golledge; Item Type: Crystals; ESR (Equivalent Series Resistance): 50R; Frequency: 32MHz; Frequency Stability: 15ppm; Load Capacitance: 8pF; Tolerance: 0.001%; Supplier: Digikey; Supplier Part Number: 5254-MP06003CT-ND; Manufacturer Part Number: MP06003; RoHS: No; Stock: 39472; Pricing: 1=0.35, 10=0.305, 50=0.2744, 100=0.2624, 500=0.23662, 1000=0.22633 (USD); Pins: 4NUMBER